# Altium schematic sheet ADAU_PERIPHERALS.SchDoc
size A; SheetNumber: 8; SheetTotal: 9
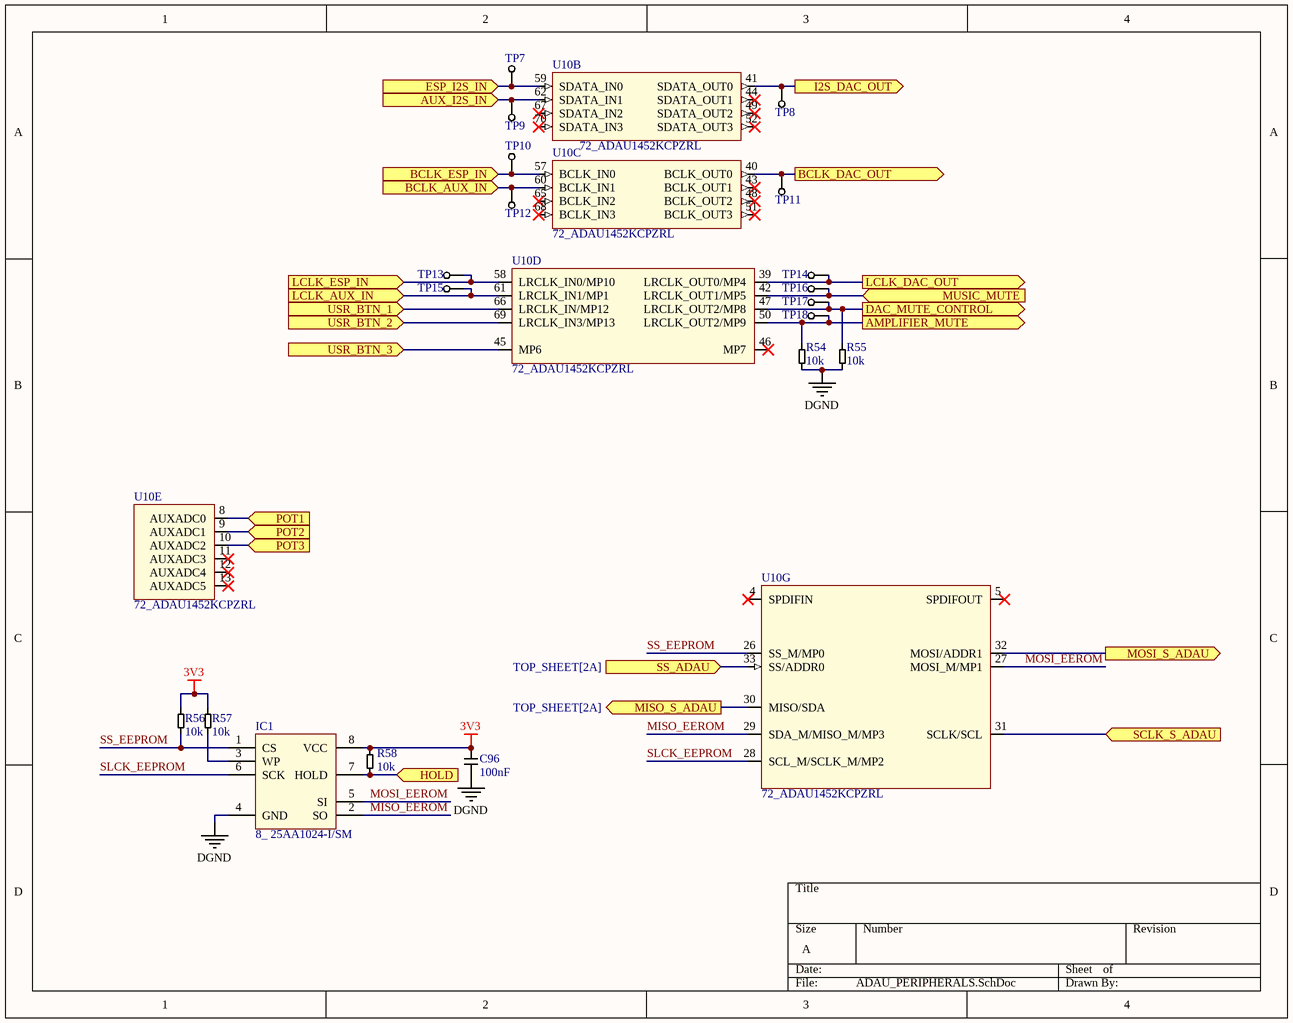
[diagram p0: ADAU_PERIPHERALS.SchDoc]

## Parts
C96  100nF  [0603_SMD_CAP]
IC1  8_ 25AA1024-I/SM  [SOIC-8_ 25AA1024-I/SM]
R54  10k  [0603_SMD_PACKAGE]
R55  10k  [0603_SMD_PACKAGE]
R56  10k  [0603_SMD_PACKAGE]
R57  10k  [0603_SMD_PACKAGE]
R58  10k  [0603_SMD_PACKAGE]
TP7  Test_punt  [round pad]  (value not drawn)
TP8  Test_punt  [round pad]  (value not drawn)
TP9  Test_punt  [round pad]  (value not drawn)
TP10  Test_punt  [round pad]  (value not drawn)
TP11  Test_punt  [round pad]  (value not drawn)
TP12  Test_punt  [round pad]  (value not drawn)
TP13  Test_punt  [round pad]  (value not drawn)
TP14  Test_punt  [round pad]  (value not drawn)
TP15  Test_punt  [round pad]  (value not drawn)
TP16  Test_punt  [round pad]  (value not drawn)
TP17  Test_punt  [round pad]  (value not drawn)
TP18  Test_punt  [round pad]  (value not drawn)
U10  72_ADAU1452KCPZRL  [QFN-72_ADAU1452KCPZRL]  (parts B,C,D,E,G of 7)

## Ports
AMPLIFIER_MUTE (out, see TOP_SHEET[3B], AMPLIFIER_SHEET[1C]), AUX_I2S_IN (in, see TOP_SHEET[2B]), BCLK_AUX_IN (in, see TOP_SHEET[2B]), BCLK_DAC_OUT (out, see TOP_SHEET[2B]), BCLK_ESP_IN (in, see TOP_SHEET[2A]), DAC_MUTE_CONTROL (out, see TOP_SHEET[3B], DAC_SHEET[1B]), ESP_I2S_IN (in, see TOP_SHEET[2A]), HOLD (in, see TOP_SHEET[2A]), I2S_DAC_OUT (out, see TOP_SHEET[2B]), LCLK_AUX_IN (in, see TOP_SHEET[2B]), LCLK_DAC_OUT (out, see TOP_SHEET[2B]), LCLK_ESP_IN (in, see TOP_SHEET[2A]), MISO_S_ADAU (out, see TOP_SHEET[2A]), MOSI_S_ADAU (out, see TOP_SHEET[2A]), MUSIC_MUTE (in, see TOP_SHEET[3B], PERIPHERAL_SHEET[2D]), POT1 (in, see TOP_SHEET[3A], PERIPHERAL_SHEET[3B]), POT2 (in, see TOP_SHEET[3A], PERIPHERAL_SHEET[3C]), POT3 (in, see TOP_SHEET[3A], PERIPHERAL_SHEET[3C]), SCLK_S_ADAU (in, see TOP_SHEET[2A]), SS_ADAU (in, see TOP_SHEET[2A]), USR_BTN_1 (in, see TOP_SHEET[3A], PERIPHERAL_SHEET[2A]), USR_BTN_2 (in, see TOP_SHEET[3B], PERIPHERAL_SHEET[3A]), USR_BTN_3 (in, see TOP_SHEET[3B], PERIPHERAL_SHEET[4A])

## Nets
3V3: C96.1 IC1.8(VCC) R56.2 R57.2 R58.2
DGND: C96.2 IC1.4(GND) R54.1 R55.1
AMPLIFIER_MUTE: R54.2 TP18.1 U10.50(LRCLK_OUT2/MP9) ; port AMPLIFIER_MUTE
AUX_I2S_IN: TP9.1 U10.62(SDATA_IN1) ; port AUX_I2S_IN
BCLK_AUX_IN: TP12.1 U10.60(BCLK_IN1) ; port BCLK_AUX_IN
BCLK_DAC_OUT: TP11.1 U10.40(BCLK_OUT0) ; port BCLK_DAC_OUT
BCLK_ESP_IN: TP10.1 U10.57(BCLK_IN0) ; port BCLK_ESP_IN
DAC_MUTE_CONTROL: R55.2 TP17.1 U10.47(LRCLK_OUT2/MP8) ; port DAC_MUTE_CONTROL
ESP_I2S_IN: TP7.1 U10.59(SDATA_IN0) ; port ESP_I2S_IN
HOLD: IC1.7(HOLD) R58.1 ; port HOLD
I2S_DAC_OUT: TP8.1 U10.41(SDATA_OUT0) ; port I2S_DAC_OUT
LCLK_AUX_IN: TP15.1 U10.61(LRCLK_IN1/MP1) ; port LCLK_AUX_IN
LCLK_DAC_OUT: TP14.1 U10.39(LRCLK_OUT0/MP4) ; port LCLK_DAC_OUT
LCLK_ESP_IN: TP13.1 U10.58(LRCLK_IN0/MP10) ; port LCLK_ESP_IN
MISO_EEROM: IC1.2(SO) U10.29(SDA_M/MISO_M/MP3)
MISO_S_ADAU: U10.30(MISO/SDA) ; port MISO_S_ADAU
MOSI_EEROM: IC1.5(SI) U10.27(MOSI_M/MP1)
MOSI_S_ADAU: U10.32(MOSI/ADDR1) ; port MOSI_S_ADAU
MUSIC_MUTE: TP16.1 U10.42(LRCLK_OUT1/MP5) ; port MUSIC_MUTE
POT1: U10.8(AUXADC0) ; port POT1
POT2: U10.9(AUXADC1) ; port POT2
POT3: U10.10(AUXADC2) ; port POT3
SCLK_S_ADAU: U10.31(SCLK/SCL) ; port SCLK_S_ADAU
SLCK_EEPROM: IC1.6(SCK) U10.28(SCL_M/SCLK_M/MP2)
SS_ADAU: U10.33(SS/ADDR0) ; port SS_ADAU
SS_EEPROM: IC1.1(CS) R56.1 U10.26(SS_M/MP0)
USR_BTN_1: U10.66(LRCLK_IN/MP12) ; port USR_BTN_1
USR_BTN_2: U10.69(LRCLK_IN3/MP13) ; port USR_BTN_2
USR_BTN_3: U10.45(MP6) ; port USR_BTN_3
NetIC1_3: IC1.3(WP) R57.1

Not connected (* = marked no-connect by the designer): U10 4(SPDIFIN)* 5(SPDIFOUT)* 11(AUXADC3)* 12(AUXADC4)* 13(AUXADC5)* 43(BCLK_OUT1)* 44(SDATA_OUT1)* 46(MP7)* 48(BCLK_OUT2)* 49(SDATA_OUT2)* 51(BCLK_OUT3)* 52(SDATA_OUT3)* 65(BCLK_IN2)* 67(SDATA_IN2)* 68(BCLK_IN3)* 70(SDATA_IN3)*

## Library data of the parts
C96 = ceramic capacator: type: *
IC1 = 8_ 25AA1024-I/SM: EEPROM, 1Mbit, SPI, max 20 MHz, 1.8V-5.5V; Supplier 1: Future Electronics; Supplier Part Number 1: 25AA1024-I/SM
R54-R58 = resistor: type: *
U10 = 72_ADAU1452KCPZRL: DSP,4xI2S,I2C,SPI,1.2V-3.6V,16channels, 10 bit resolution, max_clk = 294MHz; Supplier 1: Arrow Electronics; Supplier Part Number 1: ADAU1452KCPZ